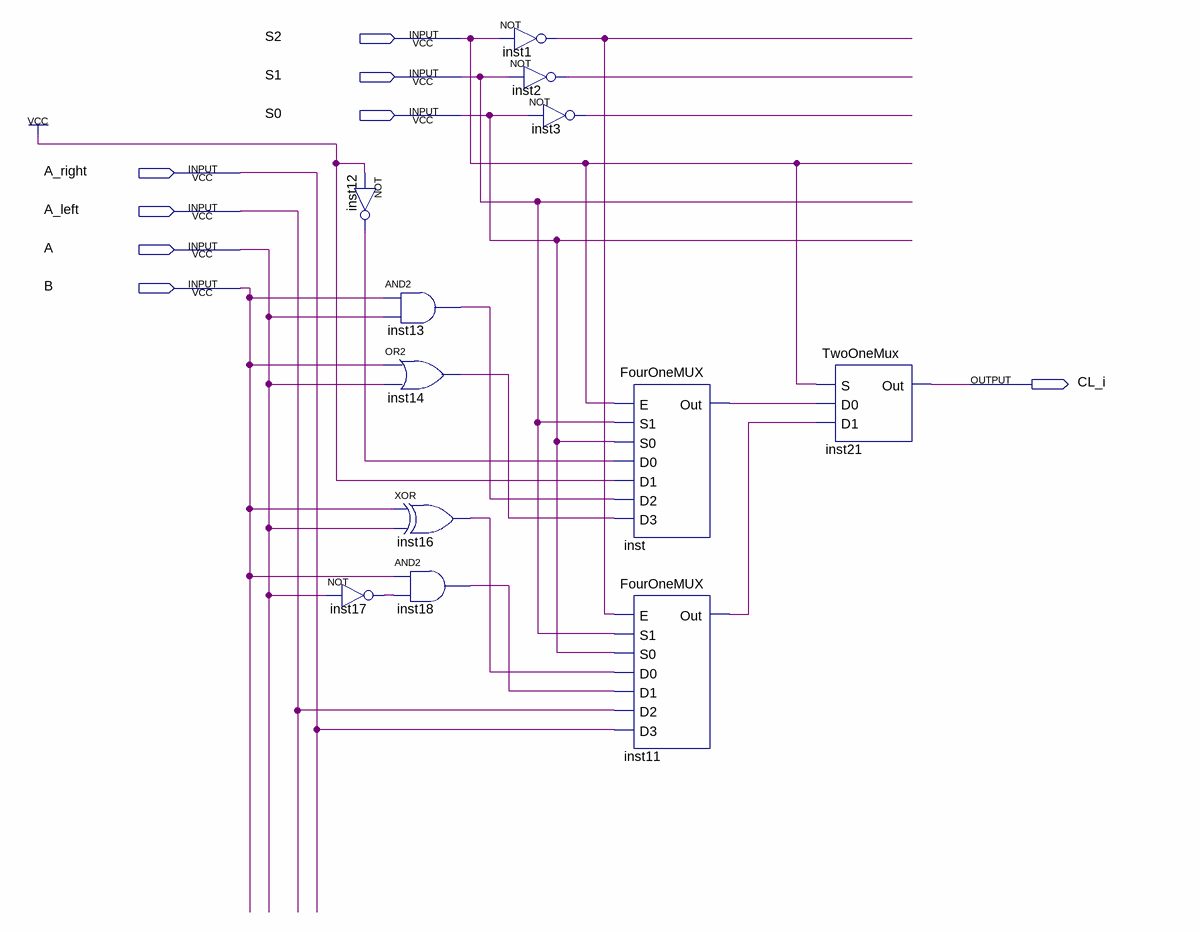
[diagram p0: schematic sheet]
// Quartus schematic 1bitLogicCircuit.bdf as structural Verilog: 12 symbols, 8 pins
module \1bitLogicCircuit  (
  input  S2,
  input  S1,
  input  S0,
  input  A_right,
  input  A_left,
  input  A,
  input  B,
  output CL_i
);

  wire inst1_out, inst2_out, inst3_out, inst11_out, inst12_out, inst13_out, inst14_out, inst16_out,
       inst17_out, inst18_out, inst_out;

  not inst12 (inst12_out, 1'b1);
  not inst17 (inst17_out, A);
  and inst13 (inst13_out, B, A);
  or inst14 (inst14_out, B, A);
  xor inst16 (inst16_out, B, A);
  and inst18 (inst18_out, B, inst17_out);
  not inst1 (inst1_out, S2);
  not inst2 (inst2_out, S1);
  not inst3 (inst3_out, S0);
  FourOneMUX inst (
    .E(S2), .S1(S1), .S0(S0), .D0(inst12_out), .D1(1'b1), .D2(inst13_out), .D3(inst14_out), .Out(inst_out));
  FourOneMUX inst11 (
    .E(inst1_out), .S1(S1), .S0(S0), .D0(inst16_out), .D1(inst18_out), .D2(A_left), .D3(A_right),
    .Out(inst11_out));
  TwoOneMux inst21 (.S(S2), .D0(inst_out), .D1(inst11_out), .Out(CL_i));
endmodule
